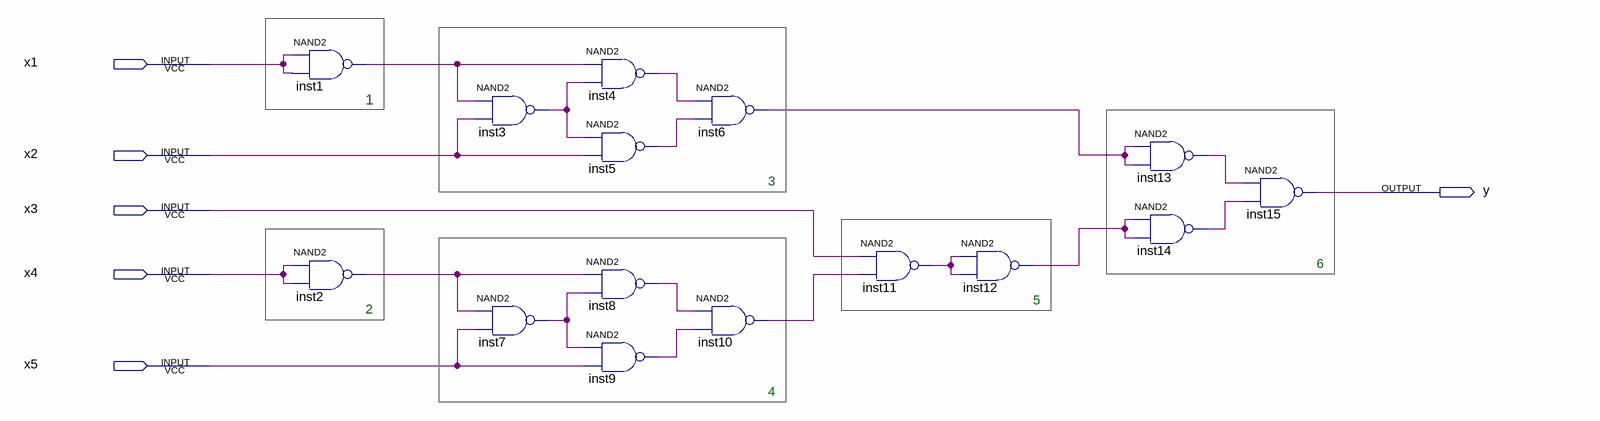
[diagram p0: schematic sheet]
// Quartus schematic nand_basis.bdf as structural Verilog: 15 symbols, 6 pins
module nand_basis (
  input  x1,
  input  x2,
  input  x3,
  input  x4,
  input  x5,
  output y
);

  wire inst1_out, inst2_out, inst3_out, inst4_out, inst5_out, inst6_out, inst7_out, inst8_out, inst9_out,
       inst10_out, inst11_out, inst12_out, inst13_out, inst14_out;

  nand inst1 (inst1_out, x1, x1);
  nand inst2 (inst2_out, x4, x4);
  nand inst3 (inst3_out, inst1_out, x2);
  nand inst7 (inst7_out, inst2_out, x5);
  nand inst4 (inst4_out, inst1_out, inst3_out);
  nand inst5 (inst5_out, inst3_out, x2);
  nand inst8 (inst8_out, inst2_out, inst7_out);
  nand inst9 (inst9_out, inst7_out, x5);
  nand inst6 (inst6_out, inst4_out, inst5_out);
  nand inst10 (inst10_out, inst8_out, inst9_out);
  nand inst11 (inst11_out, x3, inst10_out);
  nand inst12 (inst12_out, inst11_out, inst11_out);
  nand inst13 (inst13_out, inst6_out, inst6_out);
  nand inst14 (inst14_out, inst12_out, inst12_out);
  nand inst15 (y, inst13_out, inst14_out);

  // Notes on the sheet:
  //   1
  //   3
  //   6
  //   5
  //   2
  //   4
endmodule
